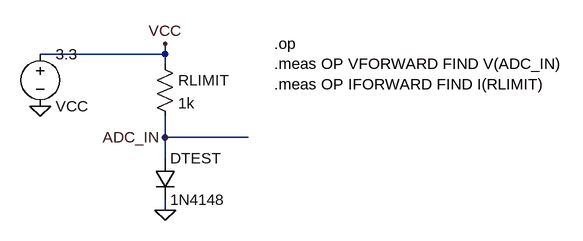
[diagram p0: schematic Diode_Forward_1N4148.asc]
Diode_Forward_1N4148.asc, the LTspice schematic file:
Version 4
SHEET 1 880 680
WIRE 160 80 352 80
WIRE 352 80 352 64
WIRE 352 96 352 64
WIRE 352 208 352 176
WIRE 352 208 480 208
WIRE 352 240 352 208
WIRE 352 320 352 304
FLAG 352 64 VCC
FLAG 352 208 ADC_IN
FLAG 352 320 0
FLAG 160 160 0
SYMBOL voltage 160 64 R0
WINDOW 0 24 96 Left 2
WINDOW 3 24 16 Left 2
SYMATTR InstName VCC
SYMATTR Value 3.3
SYMBOL res 336 80 R0
SYMATTR InstName RLIMIT
SYMATTR Value 1k
SYMBOL diode 336 240 R0
SYMATTR InstName DTEST
SYMATTR Value 1N4148
TEXT 520 64 Left 2 !.op\n.meas OP VFORWARD FIND V(ADC_IN)\n.meas OP IFORWARD FIND I(RLIMIT)

The netlist it stands for:
* Diode_Forward_1N4148.asc
VCC VCC 0 3.3
RLIMIT VCC ADC_IN 1k
DTEST ADC_IN 0 1N4148
.model D D
.lib standard.dio
.op
.meas OP VFORWARD FIND V(ADC_IN)
.meas OP IFORWARD FIND I(RLIMIT)
.backanno
.end

* Results of the author's LTspice run, read from the files saved beside the schematic
* Operating Point:
*   V(adc_in) = 630.2 mV
*   V(vcc) = 3.3 V
*   I(DTEST) = 2.67 mA
*   I(RLIMIT) = 2.67 mA
*   I(VCC) = -2.67 mA
* From the log:
*   vforward: V(ADC_IN)=0.630188763323 at 0.630188763323
*   iforward: I(RLIMIT)=0.00266981124878 at 0.630188763323